# Altium schematic sheet stm32wl55jci7-details.SchDoc
size A3; DocumentNumber: 5; SheetNumber: 5; SheetTotal: 5; Organization: Arribada Initiative; Address1: https://github.com/arribada; Address2: contact@arribada.org; Address3: arribada.org; Address4: UK - Porthmouth
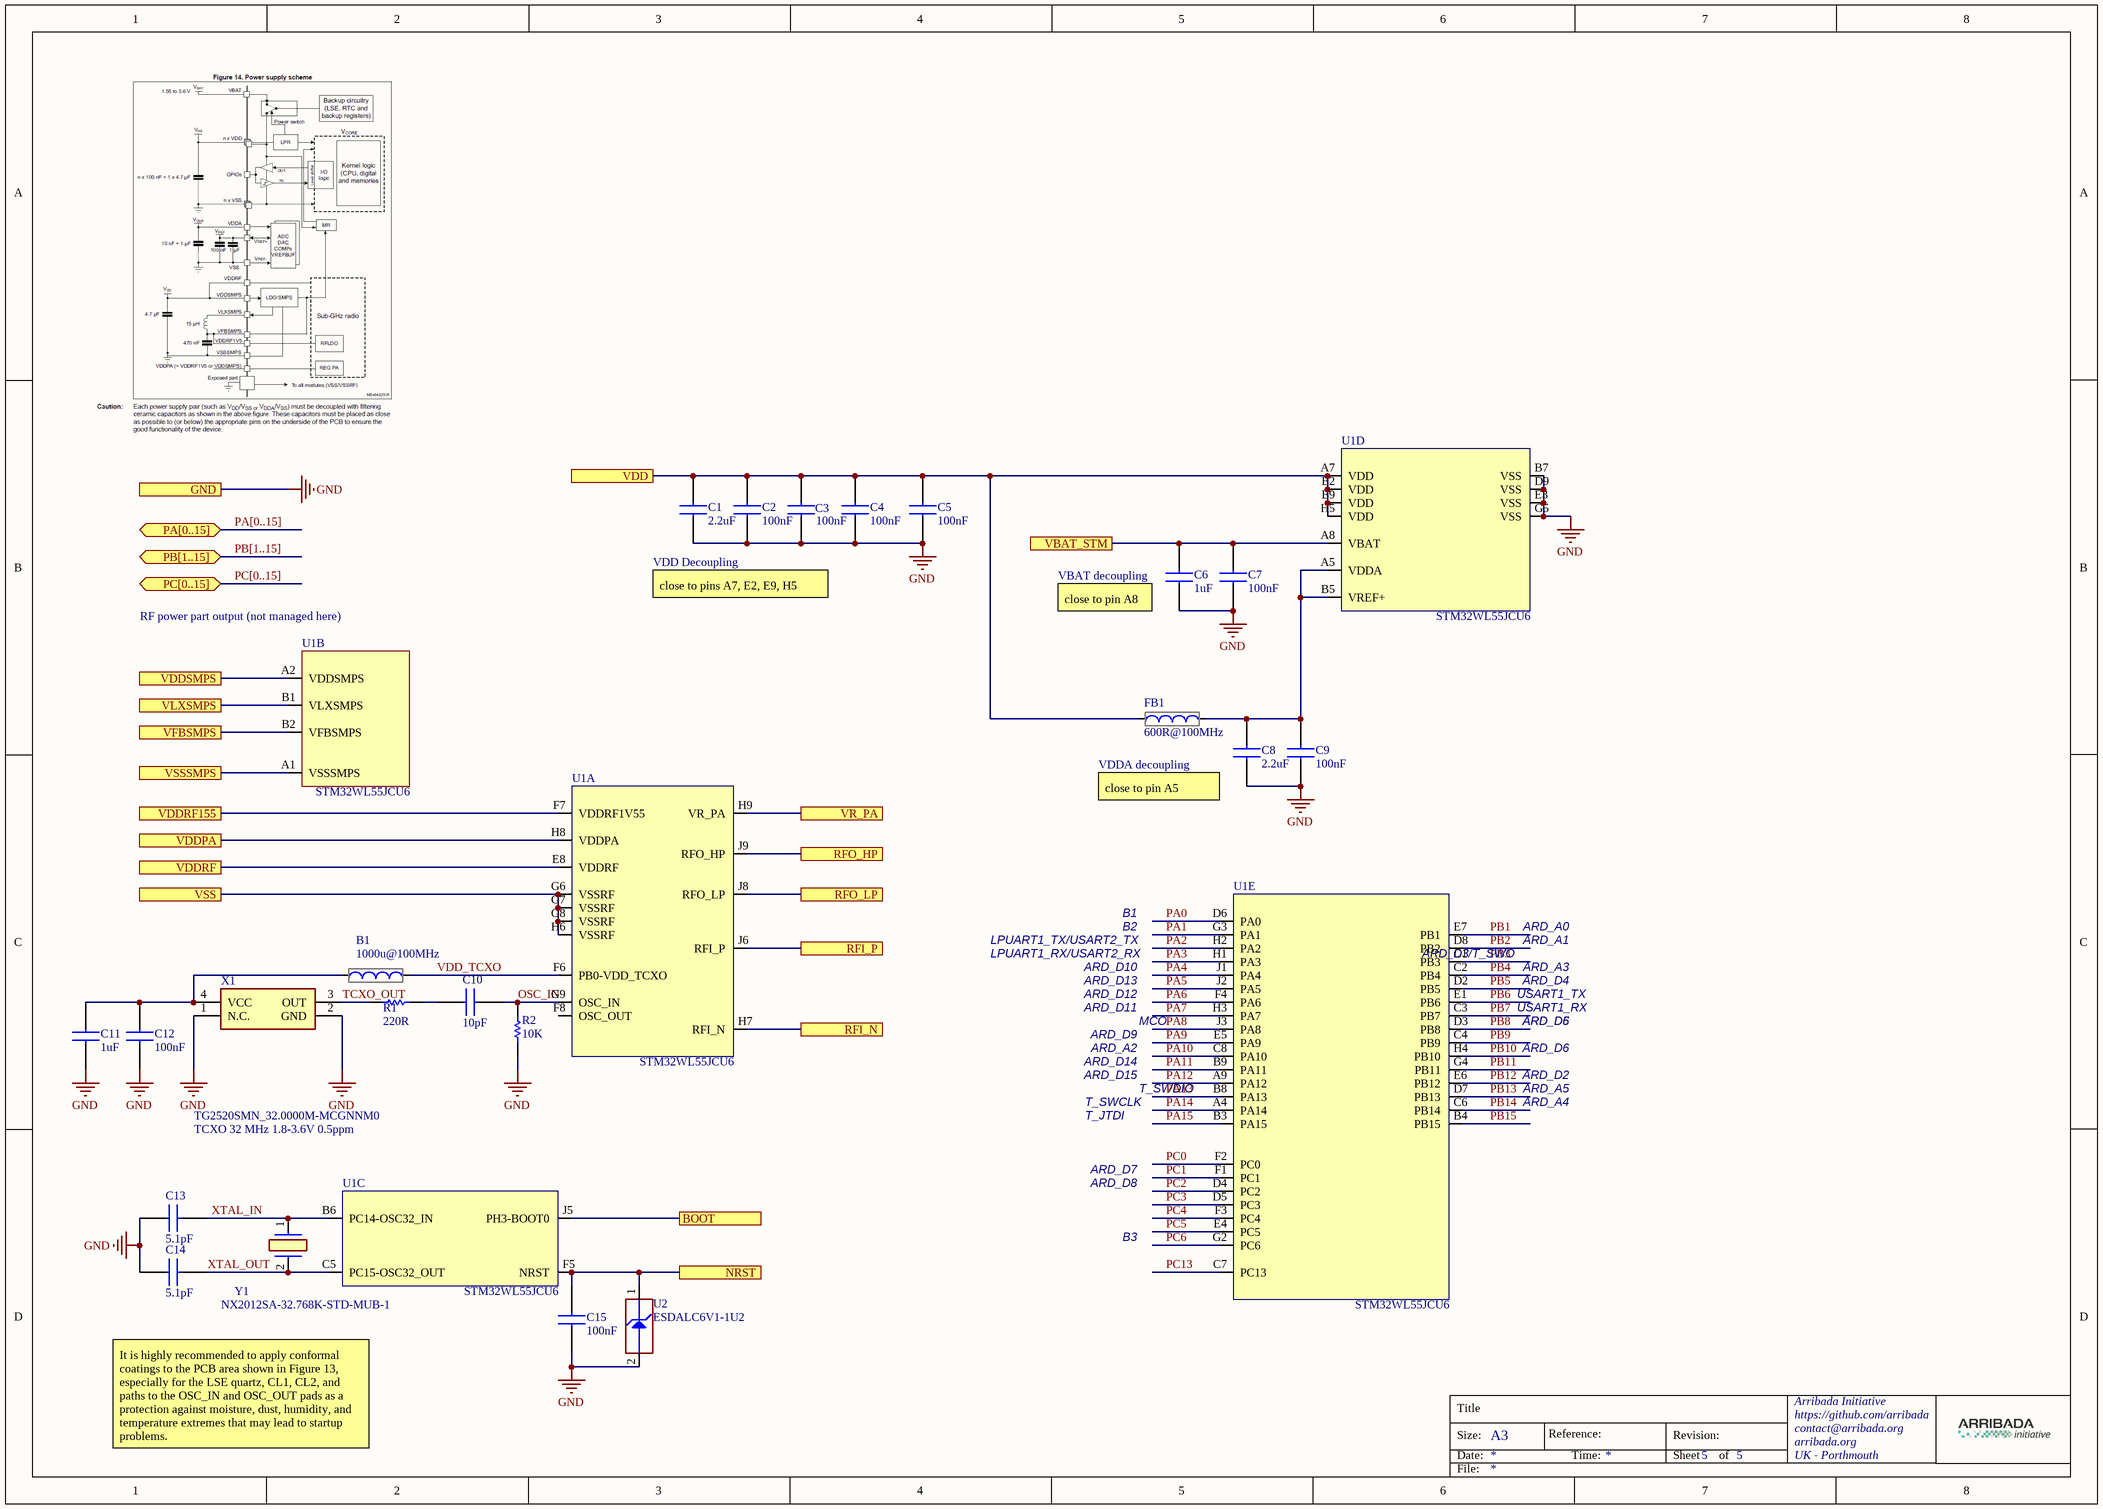
[diagram p0: stm32wl55jci7-details.SchDoc]

## Parts
B1  1000u@100MHz  [NFZ15SG152SN10B]
C1  value 2.2uF  [CAPC1005X55N]  (hidden comment: GRM155Z71A225KE44D)
C2  100nF  [CAPC0603X33N]
C3  100nF  [CAPC0603X33N]
C4  100nF  [CAPC0603X33N]
C5  100nF  [CAPC0603X33N]
C6  1uF  [CAPC0603X35N]
C7  100nF  [CAPC0603X33N]
C8  value 2.2uF  [CAPC1005X55N]  (hidden comment: GRM155Z71A225KE44D)
C9  100nF  [CAPC0603X33N]
C10  10pF  [CAPC1005X55N]
C11  1uF  [CAPC0603X35N]
C12  100nF  [CAPC0603X33N]
C13  5.1pF  [CAPC1005X55N]
C14  5.1pF  [CAPC1005X55N]
C15  100nF  [CAPC0603X33N]
FB1  600R@100MHz  [NFZ15SG152SN10B]
R1  220R  [0402]
R2  10K  [RESC0603X28N]
U1  Manufacturer_Part_Number: STM32WL55JCU6  [BGA73C50P9X9_500X500X60]  (hidden comment: STM32WL55JCI7_details)  (parts A,B,C,D,E of 5)
U2  Manufacturer_Part_Number: ESDALC6V1-1U2  [DIOM0603X03N]  (hidden comment: ESD_6V)
X1  TG2520SMN_32.0000M-MCGNNM0  [TG2520SMN320000MMCGNNM0]
Y1  NX2012SA-32.768K-STD-MUB-1  [NX2012SA32768KSTDMUB1]

## Ports
BOOT (see 2[3B]), GND (see 2[3B]), NRST (see 2[3B]), PA[0..15] (bidir, see 2[4B]), PB[1..15] (bidir, see 2[4B]), PC[0..15] (bidir, see 2[4C]), RFI_N (see 2[4B]), RFI_P (see 2[4B]), RFO_HP (see 2[4B]), RFO_LP (see 2[4B]), VBAT_STM (see 2[3B]), VDD (see 2[3B]), VDDPA (see 2[3B], 4[3C]), VDDRF155 (see 2[3B], 4[2C]), VDDRF (see 2[3B]), VDDSMPS (see 2[3B]), VFBSMPS (see 2[3C]), VLXSMPS (see 2[3B]), VR_PA (see 2[4B]), VSS (see 2[3B]), VSSSMPS (see 2[3C])

## Nets
GND: C1.1 C2.1 C3.1 C4.1 C5.1 C6.1 C7.2 C8.1 C9.1 C11.2 C12.2 C13.1 C14.1 C15.1 R2.1 U1.B7(VSS) U1.D9(VSS) U1.E3(VSS) U1.G5(VSS) U2.2(GND) X1.1(N.C.) X1.2(GND) ; port GND
BOOT: U1.J5(PH3-BOOT0) ; port BOOT
NRST: C15.2 U1.F5(NRST) U2.1(IO1) ; port NRST
OSC_IN: C10.2 R2.2 U1.G9(OSC_IN)
PA0: U1.D6(PA0)
PA1: U1.G3(PA1)
PA2: U1.H2(PA2)
PA3: U1.H1(PA3)
PA4: U1.J1(PA4)
PA5: U1.J2(PA5)
PA6: U1.F4(PA6)
PA7: U1.H3(PA7)
PA8: U1.J3(PA8)
PA9: U1.E5(PA9)
PA10: U1.C8(PA10)
PA11: U1.B9(PA11)
PA12: U1.A9(PA12)
PA13: U1.B8(PA13)
PA14: U1.A4(PA14)
PA15: U1.B3(PA15)
PB1: U1.E7(PB1)
PB2: U1.D8(PB2)
PB3: U1.C1(PB3)
PB4: U1.C2(PB4)
PB5: U1.D2(PB5)
PB6: U1.E1(PB6)
PB7: U1.C3(PB7)
PB8: U1.D3(PB8)
PB9: U1.C4(PB9)
PB10: U1.H4(PB10)
PB11: U1.G4(PB11)
PB12: U1.E6(PB12)
PB13: U1.D7(PB13)
PB14: U1.C6(PB14)
PB15: U1.B4(PB15)
PC0: U1.F2(PC0)
PC1: U1.F1(PC1)
PC2: U1.D4(PC2)
PC3: U1.D5(PC3)
PC4: U1.F3(PC4)
PC5: U1.E4(PC5)
PC6: U1.G2(PC6)
PC13: U1.C7(PC13)
RFI_N: U1.H7(RFI_N) ; port RFI_N
RFI_P: U1.J6(RFI_P) ; port RFI_P
RFO_HP: U1.J9(RFO_HP) ; port RFO_HP
RFO_LP: U1.J8(RFO_LP) ; port RFO_LP
TCXO_OUT: R1.1 X1.3(OUT)
VBAT_STM: C6.2 C7.1 U1.A8(VBAT) ; port VBAT_STM
VDD: C1.2 C2.2 C3.2 C4.2 C5.2 FB1.1 U1.A7(VDD) U1.E2(VDD) U1.E9(VDD) U1.H5(VDD) ; port VDD
VDD_TCXO: B1.2 U1.F6(PB0-VDD_TCXO)
VDDPA: U1.H8(VDDPA) ; port VDDPA
VDDRF: U1.E8(VDDRF) ; port VDDRF
VDDRF155: U1.F7(VDDRF1V55) ; port VDDRF155
VDDSMPS: U1.A2(VDDSMPS) ; port VDDSMPS
VFBSMPS: U1.B2(VFBSMPS) ; port VFBSMPS
VLXSMPS: U1.B1(VLXSMPS) ; port VLXSMPS
VR_PA: U1.H9(VR_PA) ; port VR_PA
VSS: U1.G6(VSSRF) U1.G7(VSSRF) U1.G8(VSSRF) U1.H6(VSSRF) ; port VSS
VSSSMPS: U1.A1(VSSSMPS) ; port VSSSMPS
XTAL_IN: C13.2 U1.B6(PC14-OSC32_IN) Y1.1
XTAL_OUT: C14.2 U1.C5(PC15-OSC32_OUT) Y1.2(CRYSTAL_2)
NetB1_1: B1.1 C11.1 C12.1 X1.4(VCC)
NetC8_2: C8.2 C9.2 FB1.2 U1.A5(VDDA) U1.B5(VREF+)
NetC10_1: C10.1 R1.2

Not connected (* = marked no-connect by the designer): U1 F8(OSC_OUT)

## Buses and harness runs
bus PA[0..15] = port PA[0..15]
bus PB[1..15] = port PB[1..15]
bus PC[0..15] = port PC[0..15]

## Notes on the sheet
- VDD Decoupling
- (near C6) VBAT decoupling
- RF power part output (not managed here)
- close to pins A7, E2, E9, H5
- (near C6) close to pin A8
- VDDA decoupling
- (near C8) close to pin A5
- B1
- LPUART1_TX/USART2_TX
- LPUART1_RX/USART2_RX
- ARD_D13
- ARD_D10
- B2
- ARD_D3/T_SWO
- ARD_A0
- ARD_A1
- ARD_A3
- ARD_D4
- ARD_D12
- ARD_D11
- ARD_D9
- ARD_A2
- MCO
- USART1_RX
- USART1_TX
- ARD_D6
- ARD_D5
- T_SWCLK
- T_JTDI
- T_SWDIO
- ARD_D14
- ARD_D15
- ARD_A4
- ARD_A5
- ARD_D2
- TCXO 32 MHz 1.8-3.6V 0.5ppm
- ARD_D7
- ARD_D8
- B3
- It is highly recommended to apply conformal coatings to the PCB area shown in Figure 13, especially for the LSE quartz, CL1, CL2, and paths to the OSC_IN and OSC_OUT pads as a protection against moisture, dust, humidity, and temperature extremes that may lead to startup problems.
- Title
- Size:
- Date:
- A3
- Reference:
- Time:
- Revision:
- Sheet
- of
- File:

## Library data of the parts
B1 = BLM15HG102SZ1D: Ferrite Bead - BLM15_Z1D Series EMI Suppression Filter 1000+/-25% at 100MHz 250mA @85; Manufacturer_Name: Murata Electronics; Geometry.Height: 0.55mm; Mouser Part Number: 81-BLM15HG102SZ1D; Mouser Price/Stock: https://www.mouser.co.uk/ProductDetail/Murata-Electronics/BLM15HG102SZ1D?qs=lEfY3O89Aqlr%2F6qMRIRYKQ%3D%3D; Manufacturer_Part_Number: BLM15HG102SZ1D; Datasheet Link: http://www.murata.com/~/media/webrenewal/support/library/catalog/products/emc/emifil/c31e.ashx?la=en-gb
C1 C8 = GRM155Z71A225KE44D: Multilayer Ceramic Capacitors MLCC - SMD/SMT 2.2 uF 10 VDC 10% 0402 X7R; Manufacturer 1: Murata; Description 1: Cap Ceramic 2.2uF 10V X7R 10% Pad SMD 0402 125C T/R; Supplier 1: Mouser; Supplier Part Number 1: 81-GRM155Z71A225KE4D; Manufacturer Part Number 1: GRM155Z71A225KE44D; RoHS 1: Yes; Category 1: Ceramic Capacitors; Stock 1: 106743; Pricing 1: 1=0,19, 10=0,077, 50=0,077, 100=0,047, 1000=0,041, 10000=0,035 (USD); Case/Package: 0402; RoHS Compliant: Yes
C2-C5 C7 C9 C12 C15 = GRM033Z71C104KE14D: Multilayer Ceramic Capacitors MLCC - SMD/SMT .1UF     16V   10%        0201; Manufacturer_Name: Murata Electronics; Manufacturer 1: Murata; Geometry.Height: 0.33mm; Description 1: Cap Ceramic 0.1uF 16V X7R 10% Pad SMD 0201 125C T/R; Mouser Part Number: 81-GRM033Z71C104KE4D; Mouser Price/Stock: https://www.mouser.co.uk/ProductDetail/Murata-Electronics/GRM033Z71C104KE14D?qs=lEfY3O89AqkdMqrSfAAk2w%3D%3D; Manufacturer_Part_Number: GRM033Z71C104KE14D; Datasheet Link: http://www.murata.com/~/media/webrenewal/support/library/catalog/products/capacitor/mlcc/c02e.pdf; Supplier 1: Mouser; Supplier Part Number 1: 81-GRM033Z71C104KE4D; Manufacturer Part Number 1: GRM033Z71C104KE14D; RoHS 1: Yes; Category 1: Ceramic Capacitors; Stock 1: 739403; Pricing 1: 1=0,1, 10=0,017, 50=0,017, 100=0,01, 1000=0,008, 10000=0,006 (USD); Case/Package: 0201; RoHS Compliant: Yes
C6 C11 = CL03A105KP3NSNC: Multilayer Ceramic Capacitors MLCC - SMD/SMT 1uF+/-10% 10V X5R 06 0201; Manufacturer_Name: SAMSUNG; Geometry.Height: 0.35mm; Mouser Part Number: 187-CL03A105KP3NSNC; Mouser Price/Stock: https://www.mouser.co.uk/ProductDetail/Samsung-Electro-Mechanics/CL03A105KP3NSNC?qs=47mY1nHWefQ3GOjXGTFrfg%3D%3D; Manufacturer_Part_Number: CL03A105KP3NSNC; Datasheet Link: https://datasheet.datasheetarchive.com/originals/distributors/DKDS-19/372696.pdf
C10 = GJM1555C1H100FB01D: Multilayer Ceramic Capacitors MLCC - SMD/SMT 10 pF 50 VDC 1% 0402 C0G (NP0); Manufacturer_Name: Murata Electronics; Mouser Part Number: 81-GJM1555C1H100FB01; Mouser Price/Stock: https://www.mouser.co.uk/ProductDetail/Murata-Electronics/GJM1555C1H100FB01D?qs=vcjNRp8H9z0fzMnyPuUw%2Fg%3D%3D; Manufacturer_Part_Number: GJM1555C1H100FB01D; Datasheet Link: https://www.murata.com/en-eu/products/productdetail?partno=GJM1555C1H100FB01%23; Height: 0.55mm; Arrow Part Number: GJM1555C1H100FB01D; Arrow Price/Stock: https://www.arrow.com/en/products/gjm1555c1h100fb01d/murata-manufacturing
C13 C14 = 0402N5R1B500CT: Multilayer Ceramic Capacitors MLCC - SMD/SMT 0402 MLCC NPO 5.1 pF, +/- 0.1pF 50 V T&R GP; Manufacturer 1: Walsin Technologies; Description 1: Chip Capacitor 0402 MLCC NPO 5.1 pF+/- 0.1pF 50 V T&R GP; Supplier 1: Mouser; Supplier Part Number 1: 791-0402N5R1B500CT; Manufacturer Part Number 1: 0402N5R1B500CT; Stock 1: 9644; Pricing 1: 1=0,1, 10=0,048, 50=0,048, 100=0,022, 1000=0,013, 10000=0,008 (USD); ComponentLink1URL: https://datasheet.octopart.com/0402N5R1B500CT-Walsin-Technologies-datasheet-136037192.pdf?src-supplier=TECHDesign; ComponentLink1Description: https://datasheet.octopart.com/0402N5R1B500CT-Walsin-Technologies-datasheet-136037192.pdf?src-supplier=TECHDesign; ComponentLink2URL: https://datasheet.octopart.com/0402N5R1B500CT-Walsin-Technologies-datasheet-26371553.pdf; ComponentLink2Description: https://datasheet.octopart.com/0402N5R1B500CT-Walsin-Technologies-datasheet-26371553.pdf; RoHS 1: No
FB1 = BLM15BX601SZ1D: Ferrite Bead 600ohm 500mA 340mOhm 0402; Manufacturer_Name: Murata Electronics; Datasheet Link: http://www.murata.com/~/media/webrenewal/support/library/catalog/products/emc/emifil/c31e.ashx?la=en-gb; Height: 0.55mm; Manufacturer_Part_Number: BLM15BX601SZ1D; Mouser Part Number: 81-BLM15BX601SZ1D; Mouser Price/Stock: https://www.mouser.com/Search/Refine.aspx?Keyword=81-BLM15BX601SZ1D
R1 = HP02WAF2200TCE: Resistors Thick Film - SMD HP02 (0402) 1/10W 1% 220R T/R-10000; Manufacturer: Royal Electronic Factory; Supplier 1: Mouser; Manufacturer Part Number: HP02WAF2200TCE; RoHS: No; Pricing 1: 10000=0,018 (USD); Supplier Part Number 1: 303-HP02WAF2200TCE
R2 = AF0201FR-0710KL: Resistor Thick Film Anti-Sulfurated Chip 0201 10kOhm 1% Paper T/R; Manufacturer: Yageo; Resistance: 10kR; Max Power Dissipation: 50mW; Temperature Coefficient: 200ppm/°C; Description 1: Anti-Sulfurated Chip Resistor Thick Film 0201 10kOhm 1% Paper T/R; Category 1: Chip SMD Resistors; Value: 10kR; Supplier 1: Mouser; Manufacturer Part Number: AF0201FR-0710KL; RoHS: Yes; Category: Chip SMD Resistors; Stock 1: 42720; Pricing 1: 1=0,15, 10=0,057, 50=0,057, 100=0,031, 1000=0,019, 10000=0,011 (USD); Case/Package: 0201; Min Operating Temperature: -55°C; Max Operating Temperature: 125°C; Packaging: Tape and Reel; Number of Terminations: 2; Tolerance: 1%; Features: Moisture Resistant,Anti-Sulfur; Series: AF; RoHS Compliant: Yes; ComponentLink1URL: https://www.yageo.com/upload/media/product/productsearch/datasheet/rchip/PYu-AF_51_RoHS_L_6.pdf?src-supplier=Digi-Key; ComponentLink1Description: https://www.yageo.com/upload/media/product/productsearch/datasheet/rchip/PYu-AF_51_RoHS_L_6.pdf?src-supplier=Digi-Key; ComponentLink2Description: Mouser; ComponentLink2URL: https://www.mouser.fr/ProductDetail/YAGEO/AF0201FR-0710KL?qs=tggtontpCXMMc5XUOoECzA%3D%3D; Supplier Part Number 1: 603-AF0201FR-0710KL; Manufacturer 1: Yageo; Manufacturer Part Number 1: AF0201FR-0710KL; RoHS 1: Yes
U1 = STM32WL55JCI7_details: Multiprotocol Wireless 32-bit MCUwith LPWAN Sub-GHz radio solution(BGA); Manufacturer: STMICROELECTRONICS; Description 1: 16/32-BITS Micros; Category 1: Microcontrollers; Supplier 1: Mouser; Supplier Part Number 1: 511-STM32WL55JCI7; Manufacturer 1: STMicroelectronics; Manufacturer Part Number 1: STM32WL55JCI7; RoHS 1: Yes; Stock 1: 3639; Pricing 1: 1=11,79, 10=10,83, 50=10,38, 100=9,15, 1000=7,4, 10000=7,4 (USD)
U2 = ESD_6V: ESD protection 6V1 - Varistors MLV 0603 18V 3pF; Manufacturer: STMICROELECTRONICS; Supplier 1: Mouser; Supplier Part Number 1: 511-ESDALC6V1-1U2
X1 = TG2520SMN_32.0000M-MCGNNM0: TCXO Oscillators TG2520SMN 32.0000M-MCGNNM0: TCXO 2.8V 3.3V 0.5PPM -40 85C NON O/E 1K TR; Manufacturer_Name: Epson Timing; Manufacturer 1: Epson; Geometry.Height: 0.8mm; Category 1: Uncategorized; Mouser Part Number: 732-2520SMN32MCGNNM0; Mouser Price/Stock: https://www.mouser.co.uk/ProductDetail/Epson-Timing/TG2520SMN-32.0000M-MCGNNM0?qs=4qgZ1GHix0UhyPXaSR8nfw%3D%3D; Manufacturer_Part_Number: TG2520SMN 32.0000M-MCGNNM0; Datasheet Link: https://support.epson.biz/td/api/doc_check.php?dl=brief_TG2520SMN&lang=en; Supplier 1: Mouser; Supplier Part Number 1: 732-2520SMN32MCGNNM0; Manufacturer Part Number 1: TG2520SMN32.0000M-MCGNNM0; RoHS 1: No; Stock 1: 1915; Pricing 1: 1=1,72, 10=1,65, 50=1,65, 100=1,38, 1000=1,12, 10000=1,05 (USD)
Y1 = NX2012SA-32.768K-STD-MUB-1: Crystals 32.768KHZ 12.5PF SMD; Manufacturer_Name: NDK; Description 1: Crystal 32.7680KHZ 12.5PF SMD; ESR (Equivalent Series Resistance): 80kR; Frequency Tolerance: 20ppm; Datasheet Link: https://www.mouser.de/datasheet/2/905/c_NX2012SA-STD-MUB-1_e-1317508.pdf; Height: 0.6mm; Manufacturer_Part_Number: NX2012SA-32.768K-STD-MUB-1; Mouser Part Number: 344-NX2012SA32768K1; Mouser Price/Stock: https://www.mouser.co.uk/ProductDetail/NDK/NX2012SA-32.768K-STD-MUB-1?qs=55YtniHzbhA%252B6%2Fl1MwFZaQ%3D%3D; Supplier 1: Mouser; Supplier Part Number 1: 344-NX2012SA32768K1; Manufacturer 1: NDK; Manufacturer Part Number 1: NX2012SA-32.768K-STD-MUB-1; RoHS 1: Yes; Category 1: Crystals; Stock 1: 65335; Pricing 1: 1=0,77, 10=0,638, 50=0,638, 100=0,536, 1000=0,426, 10000=0,377 (USD); Mount: Surface Mount; Case/Package: SMD/SMT; Min Operating Temperature: -40°C; Max Operating Temperature: 85°C; Packaging: Cut Tape; Frequency: 32.768kHz; Load Capacitance: 12.5pF; Series: NX2012SA; Length: 0.081inch; Width: 0.047inch; RoHS Compliant: Yes; ComponentLink1URL: http://www.ndk.com/images/products/catalog/c_NX2012SA-STD-MUB-1_e.pdf?src-supplier=Digi-Key; ComponentLink1Description: http://www.ndk.com/images/products/catalog/c_NX2012SA-STD-MUB-1_e.pdf?src-supplier=Digi-Key